# Altium schematic sheet MR4A16BCYS35R.SchDoc
size A3; SheetNumber: 6; SheetTotal: 10
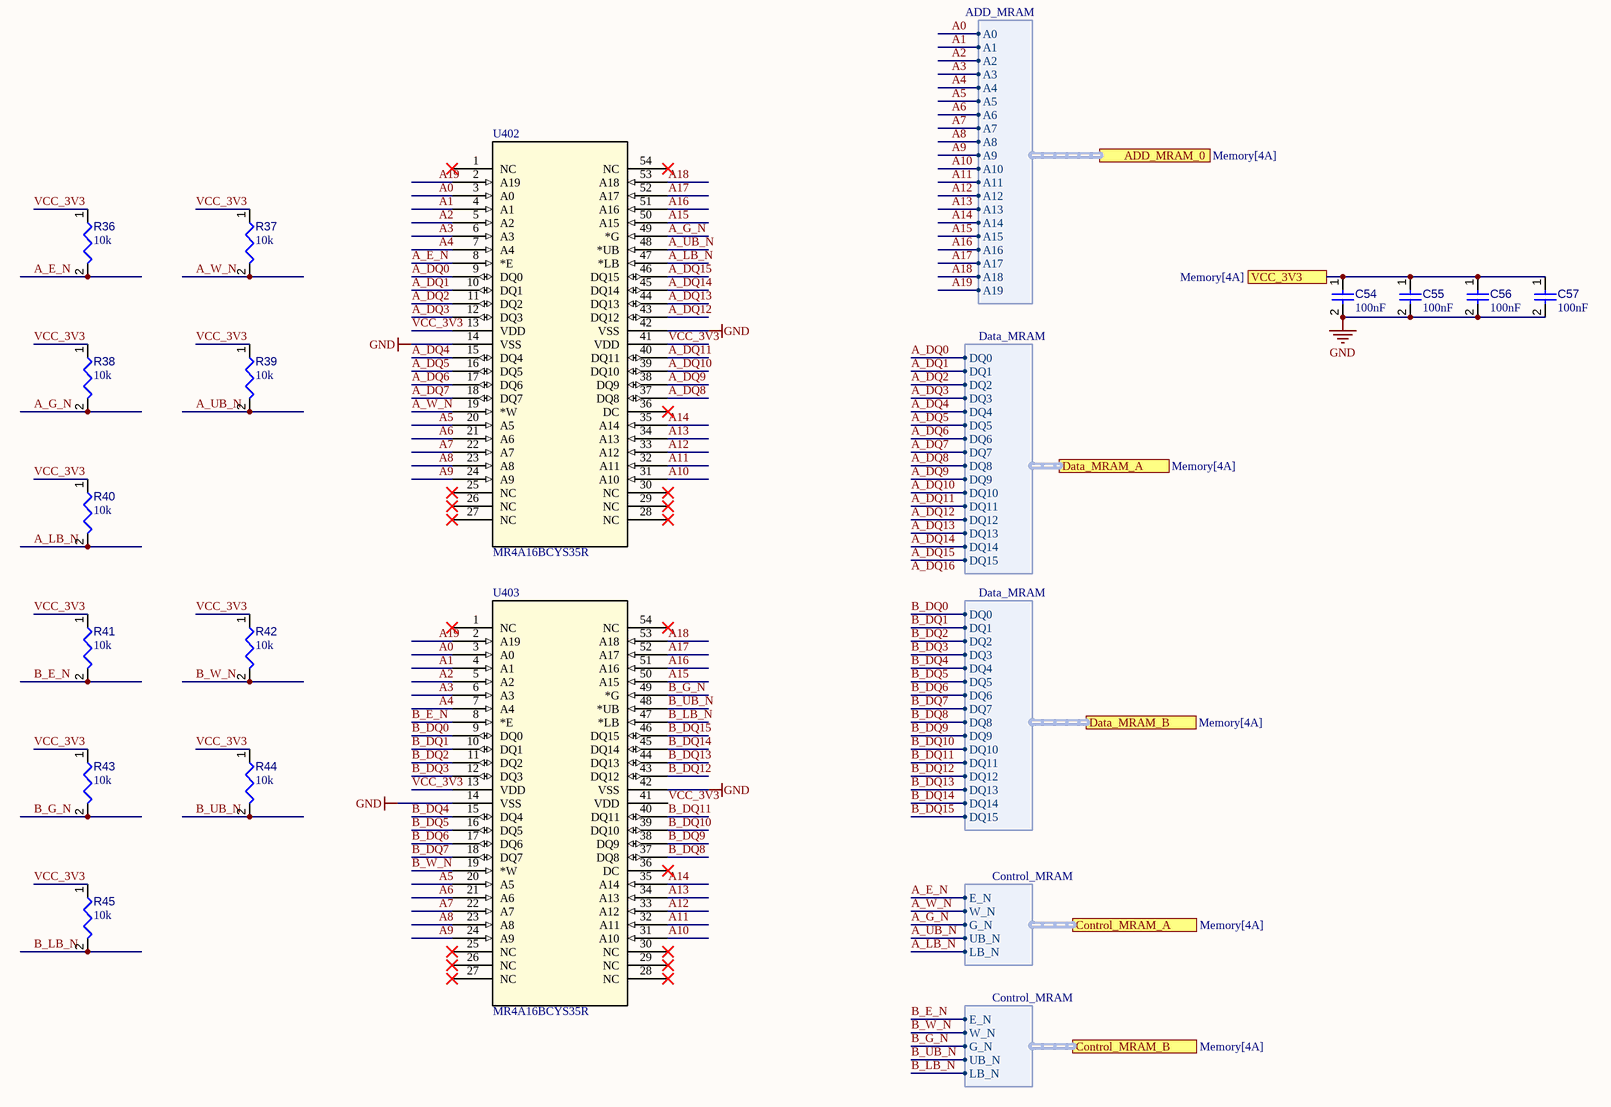
[diagram p0: MR4A16BCYS35R.SchDoc]

## Parts
C54  value 100nF  [CAPC2013X95X50LL10T25]  (hidden comment: Capacitor 100 nF +/-10% 50 V 0805)
C55  value 100nF  [CAPC2013X95X50LL10T25]  (hidden comment: Capacitor 100 nF +/-10% 50 V 0805)
C56  value 100nF  [CAPC2013X95X50LL10T25]  (hidden comment: Capacitor 100 nF +/-10% 50 V 0805)
C57  value 100nF  [CAPC2013X95X50LL10T25]  (hidden comment: Capacitor 100 nF +/-10% 50 V 0805)
R36  value 10k  [RESC2013X50X35ML15T15]  (hidden comment: Resistor 10k +/-1% 0805 125 mW)
R37  value 10k  [RESC2013X50X35ML15T15]  (hidden comment: Resistor 10k +/-1% 0805 125 mW)
R38  value 10k  [RESC2013X50X35ML15T15]  (hidden comment: Resistor 10k +/-1% 0805 125 mW)
R39  value 10k  [RESC2013X50X35ML15T15]  (hidden comment: Resistor 10k +/-1% 0805 125 mW)
R40  value 10k  [RESC2013X50X35ML15T15]  (hidden comment: Resistor 10k +/-1% 0805 125 mW)
R41  value 10k  [RESC2013X50X35ML15T15]  (hidden comment: Resistor 10k +/-1% 0805 125 mW)
R42  value 10k  [RESC2013X50X35ML15T15]  (hidden comment: Resistor 10k +/-1% 0805 125 mW)
R43  value 10k  [RESC2013X50X35ML15T15]  (hidden comment: Resistor 10k +/-1% 0805 125 mW)
R44  value 10k  [RESC2013X50X35ML15T15]  (hidden comment: Resistor 10k +/-1% 0805 125 mW)
R45  value 10k  [RESC2013X50X35ML15T15]  (hidden comment: Resistor 10k +/-1% 0805 125 mW)
U402  MR4A16BCYS35R  [TSOP2-54_EVS]
U403  MR4A16BCYS35R  [TSOP2-54_EVS]

## Ports
ADD_MRAM_0 (harness ADD_MRAM, see Memory[4A]), Control_MRAM_A (harness Control_MRAM, see Memory[4A]), Control_MRAM_B (harness Control_MRAM, see Memory[4A]), Data_MRAM_A (harness Data_MRAM, see Memory[4A]), Data_MRAM_B (harness Data_MRAM, see Memory[4A]), VCC_3V3 (see Memory[4A])

## Harnesses
ADD_MRAM: A0, A1, A2, A3, A4, A5, A6, A7, A8, A9, A10, A11, A12, A13, A14, A15, A16, A17, A18, A19
Data_MRAM: DQ0, DQ1, DQ2, DQ3, DQ4, DQ5, DQ6, DQ7, DQ8, DQ9, DQ10, DQ11, DQ12, DQ13, DQ14, DQ15
Control_MRAM: E_N, W_N, G_N, LB_N, UB_N

## Nets
GND: C54.2 C55.2 C56.2 C57.2 U402.14(VSS) U402.42(VSS) U403.14(VSS) U403.42(VSS)
A0: U402.3(A0) U403.3(A0) ; port ADD_MRAM_0.A0
A1: U402.4(A1) U403.4(A1) ; port ADD_MRAM_0.A1
A2: U402.5(A2) U403.5(A2) ; port ADD_MRAM_0.A2
A3: U402.6(A3) U403.6(A3) ; port ADD_MRAM_0.A3
A4: U402.7(A4) U403.7(A4) ; port ADD_MRAM_0.A4
A5: U402.20(A5) U403.20(A5) ; port ADD_MRAM_0.A5
A6: U402.21(A6) U403.21(A6) ; port ADD_MRAM_0.A6
A7: U402.22(A7) U403.22(A7) ; port ADD_MRAM_0.A7
A8: U402.23(A8) U403.23(A8) ; port ADD_MRAM_0.A8
A9: U402.24(A9) U403.24(A9) ; port ADD_MRAM_0.A9
A10: U402.31(A10) U403.31(A10) ; port ADD_MRAM_0.A10
A11: U402.32(A11) U403.32(A11) ; port ADD_MRAM_0.A11
A12: U402.33(A12) U403.33(A12) ; port ADD_MRAM_0.A12
A13: U402.34(A13) U403.34(A13) ; port ADD_MRAM_0.A13
A14: U402.35(A14) U403.35(A14) ; port ADD_MRAM_0.A14
A15: U402.50(A15) U403.50(A15) ; port ADD_MRAM_0.A15
A16: U402.51(A16) U403.51(A16) ; port ADD_MRAM_0.A16
A17: U402.52(A17) U403.52(A17) ; port ADD_MRAM_0.A17
A18: U402.53(A18) U403.53(A18) ; port ADD_MRAM_0.A18
A19: U402.2(A19) U403.2(A19) ; port ADD_MRAM_0.A19
A_DQ0: U402.9(DQ0) ; port Data_MRAM_A.DQ0
A_DQ1: U402.10(DQ1) ; port Data_MRAM_A.DQ1
A_DQ2: U402.11(DQ2) ; port Data_MRAM_A.DQ2
A_DQ3: U402.12(DQ3) ; port Data_MRAM_A.DQ3
A_DQ4: U402.15(DQ4) ; port Data_MRAM_A.DQ4
A_DQ5: U402.16(DQ5) ; port Data_MRAM_A.DQ5
A_DQ6: U402.17(DQ6) ; port Data_MRAM_A.DQ6
A_DQ7: U402.18(DQ7) ; port Data_MRAM_A.DQ7
A_DQ8: U402.37(DQ8) ; port Data_MRAM_A.DQ8
A_DQ9: U402.38(DQ9) ; port Data_MRAM_A.DQ9
A_DQ10: U402.39(DQ10) ; port Data_MRAM_A.DQ10
A_DQ11: U402.40(DQ11) ; port Data_MRAM_A.DQ11
A_DQ12: U402.43(DQ12) ; port Data_MRAM_A.DQ12
A_DQ13: U402.44(DQ13) ; port Data_MRAM_A.DQ13
A_DQ14: U402.45(DQ14) ; port Data_MRAM_A.DQ14
A_DQ15: U402.46(DQ15) ; port Data_MRAM_A.DQ15
A_E_N: R36.2 U402.8(*E) ; port Control_MRAM_A.E_N
A_G_N: R38.2 U402.49(*G) ; port Control_MRAM_A.G_N
A_LB_N: R40.2 U402.47(*LB) ; port Control_MRAM_A.LB_N
A_UB_N: R39.2 U402.48(*UB) ; port Control_MRAM_A.UB_N
A_W_N: R37.2 U402.19(*W) ; port Control_MRAM_A.W_N
B_DQ0: U403.9(DQ0) ; port Data_MRAM_B.DQ0
B_DQ1: U403.10(DQ1) ; port Data_MRAM_B.DQ1
B_DQ2: U403.11(DQ2) ; port Data_MRAM_B.DQ2
B_DQ3: U403.12(DQ3) ; port Data_MRAM_B.DQ3
B_DQ4: U403.15(DQ4) ; port Data_MRAM_B.DQ4
B_DQ5: U403.16(DQ5) ; port Data_MRAM_B.DQ5
B_DQ6: U403.17(DQ6) ; port Data_MRAM_B.DQ6
B_DQ7: U403.18(DQ7) ; port Data_MRAM_B.DQ7
B_DQ8: U403.37(DQ8) ; port Data_MRAM_B.DQ8
B_DQ9: U403.38(DQ9) ; port Data_MRAM_B.DQ9
B_DQ10: U403.39(DQ10) ; port Data_MRAM_B.DQ10
B_DQ11: U403.40(DQ11) ; port Data_MRAM_B.DQ11
B_DQ12: U403.43(DQ12) ; port Data_MRAM_B.DQ12
B_DQ13: U403.44(DQ13) ; port Data_MRAM_B.DQ13
B_DQ14: U403.45(DQ14) ; port Data_MRAM_B.DQ14
B_DQ15: U403.46(DQ15) ; port Data_MRAM_B.DQ15
B_E_N: R41.2 U403.8(*E) ; port Control_MRAM_B.E_N
B_G_N: R43.2 U403.49(*G) ; port Control_MRAM_B.G_N
B_LB_N: R45.2 U403.47(*LB) ; port Control_MRAM_B.LB_N
B_UB_N: R44.2 U403.48(*UB) ; port Control_MRAM_B.UB_N
B_W_N: R42.2 U403.19(*W) ; port Control_MRAM_B.W_N
VCC_3V3: R36.1 R37.1 R38.1 R39.1 R40.1 R41.1 R42.1 R43.1 R44.1 R45.1 U402.13(VDD) U402.41(VDD) U403.13(VDD) U403.41(VDD)
VCC_3V3: C54.1 C55.1 C56.1 C57.1 ; port VCC_3V3  [a separate net that carries the same name]

Not connected (* = marked no-connect by the designer): U402 1(NC)* 25(NC)* 26(NC)* 27(NC)* 28(NC)* 29(NC)* 30(NC)* 36(DC)* 54(NC)*; U403 1(NC)* 25(NC)* 26(NC)* 27(NC)* 28(NC)* 29(NC)* 30(NC)* 36(DC)* 54(NC)*

## Notes on the sheet
- Labels drawn without touching a wire or pin: A_DQ16

## Library data of the parts
C54-C57 = CMP-001-00018-6: Chip Capacitor, 100 nF, +/- 10%, 50 V, 0805 (2012 Metric); Capacitor Type: Ceramic; Voltage Rating: 50V; Pins: 2; Max Operating Temperature: 125°C; Min Operating Temperature: -55°C; Mounting Technology: SM; Case/Package: 0805; RoHS Compliant: True; Tolerance: 10%
R36-R45 = CMP-009-00018-5: Chip Resistor, 10 KOhm, +/- 1%, 125 mW, -55 to 155 degC, 0805 (2012 Metric); Manufacturer: Yageo Group; Manufacturer Part Number: RC0805FR-0710KL; Manufacturer: Vishay; Manufacturer Part Number: CRCW080510K0FKEA; Manufacturer: Panasonic / Panasonic ECG; Manufacturer Part Number: ERJ-6ENF1002V; Power: 125mW; Voltage Rating: 150V; Tolerance: 1%; Pins: 2; Min Operating Temperature: -55°C; Case/Package: 0805; Max Operating Temperature: 155°C; RoHS Compliant: True; Mounting Technology: SM; Component Type: Resistors
U402 U403 = CMP-022-000000-1: No Description Available; Manufacturer_Name: Everspin; Copyright: Copyright (C) 2026 Ultra Librarian. All rights reserved.; Type: Type; Manufacturer_Part_Number: MR4A16BCYS35R; RefDes: RefDes; Design Item ID: MR4A16BCYS35R; Source: MR4A16BCYS35R.SchLib